# Altium project Sensor.PrjPcb (part 3 of 3)
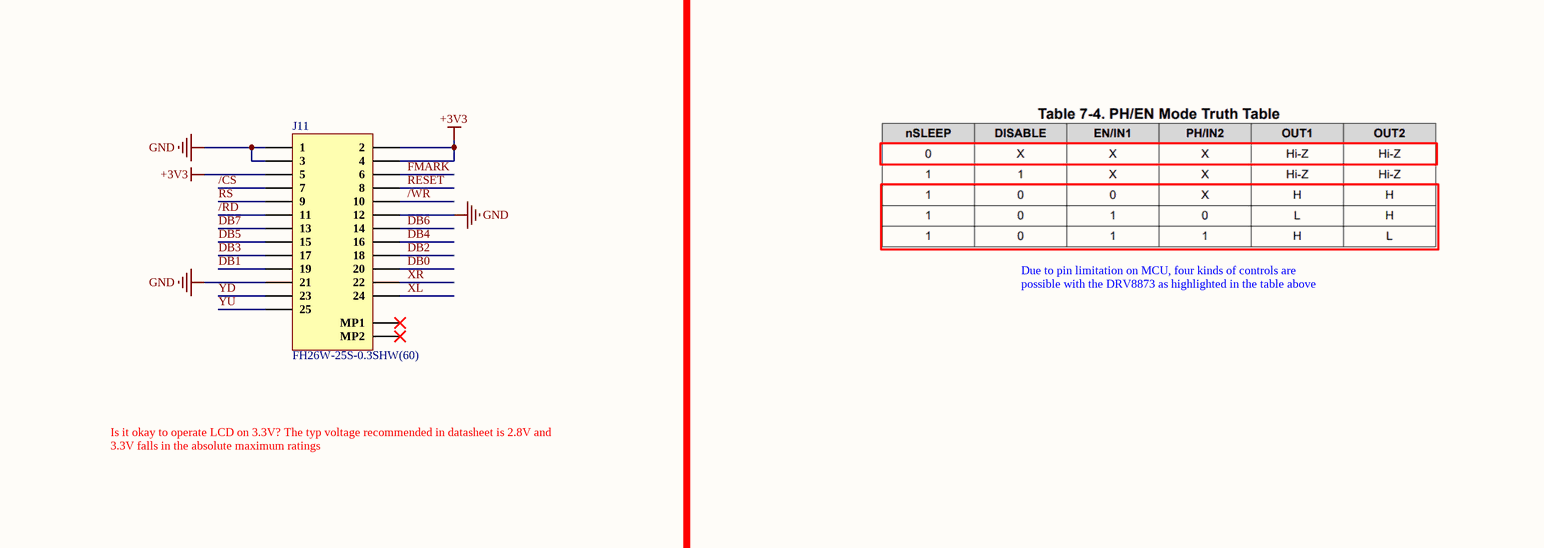
[diagram p5: Sheet4.SchDoc, bottom right]

## Sheet Sheet4.SchDoc (continued)

### Library data of the parts (continued)
R11 = CRCW04021K00FKEDHP: RES SMD 1K OHM 1% 1/5W 0402; Manufacturer: Vishay Dale; Resistance: 1kR; Temperature Coefficient: 100ppm/°C; Power Rating: 125mW; Voltage Rating: 50V; Supplier 1: Digi-Key; Manufacturer Part Number: CRCW04021K00FKEDHP; Stock 1: 315989; Pricing 1: 1=0.15, 10=0.132, 100=0.0506, 1000=0.02226, 2500=0.01923, 5000=0.0172 (USD); Mount: Surface Mount; Case/Package: 0402; Number of Pins: 2; Contact Plating: Tin; Weight: 2.3E-05oz; Case Code (Imperial): 0402; Case Code (Metric): 1005; Size Code: 0402; Min Operating Temperature: -55°C; Max Operating Temperature: 155°C; Tolerance: 1%; Resistor Type: Thick Film; Package Quantity: 10; Packaging: Tape and Reel; Number of Terminations: 2; Termination: SMD/SMT; Max Power Dissipation: 125mW; Voltage Rating (DC): 50V; Features: Automotive AEC-Q200; Series: CRCW-HP; Construction: Rectangular; Technology: THICK FILM; Resistance Tolerance: 1%; Length: 1mm; Width: 0.5mm; Height: 0.3mm; Depth: 0.5mm; Radiation Hardening: No; REACH SVHC: Unknown; Military Standard: Not; Lead Free: Lead Free; RoHS Compliant: Yes; ComponentLink1URL: http://www.farnell.com/datasheets/2339608.pdf?src-supplier=Element14; ComponentLink1Description: http://www.farnell.com/datasheets/2339608.pdf?src-supplier=Element14; ComponentLink2URL: http://www.vishay.com/docs/20043/crcwhpe3.pdf?src-supplier=Digi-Key; ComponentLink2Description: http://www.vishay.com/docs/20043/crcwhpe3.pdf?src-supplier=Digi-Key; ComponentLink3URL: http://www.mouser.com/ds/2/427/crcwhpe3-46056.pdf?src-supplier=Mouser; ComponentLink3Description: http://www.mouser.com/ds/2/427/crcwhpe3-46056.pdf?src-supplier=Mouser; ComponentLink4URL: http://www.vishay.com/docs/20043/crcwhpe3.pdf?src-supplier=Avnet; ComponentLink4Description: http://www.vishay.com/docs/20043/crcwhpe3.pdf?src-supplier=Avnet; ComponentLink5URL: http://www.vishay.com/docs/20043/crcwhpe3.pdf?src-supplier=Future+Electronics; ComponentLink5Description: http://www.vishay.com/docs/20043/crcwhpe3.pdf?src-supplier=Future+Electronics; Supplier Part Number 1: 541-1.00KYCT-ND; LCSC Part Number: C313354
R12 = CRCW06036K20JNEA: RES SMD 6.2K OHM 5% 1/10W 0603; Manufacturer: Vishay Dale; Value: 6.2kR; Temperature Coefficient: 200ppm/°C; Max Power Dissipation: 100mW; Voltage Rating: 75V; Item Type: Resistor; Supplier 1: Arrow Electronics; Manufacturer Part Number: CRCW06036K20JNEA; RoHS: Yes; Category: Chip SMD Resistors; Stock 1: 2763; Pricing 1: 1=0.06100, 10=0.02470, 25=0.02440, 50=0.02420, 100=0.01220, 250=0.01170, 500=0.01070, 1000=0.00550 (USD); Case/Package: 0603; Case Code (Metric): 1608; Case Code (Imperial): 0603; Contact Plating: Tin; Weight: 7.1E-05oz; Min Operating Temperature: -55°C; Max Operating Temperature: 155°C; Tolerance: 5%; Packaging: Tape and Reel; Resistor Type: Thick Film; Number of Terminations: 2; Features: Automotive AEC-Q200; Series: CRCW; Power Rating: 100mW; Package Quantity: 1; Termination: SMD/SMT; Voltage Rating (DC): 75V; Construction: Rectangular; Length: 1.55mm; Width: 0.033inch; Height: 0.02inch; Depth: 0.85mm; Radiation Hardening: No; Lead Free: Lead Free; RoHS Compliant: Yes; Military Standard: Not; ComponentLink1URL: https://datasheet.ciiva.com/3257/dcrcwe3-3257845.pdf?src-supplier=Avnet; ComponentLink1Description: https://datasheet.ciiva.com/3257/dcrcwe3-3257845.pdf?src-supplier=Avnet; ComponentLink2URL: https://datasheet.ciiva.com/2462/dcrcwe3-2462295.pdf?src-supplier=Digi-Key; ComponentLink2Description: https://datasheet.ciiva.com/2462/dcrcwe3-2462295.pdf?src-supplier=Digi-Key; ComponentLink3URL: https://datasheet.ciiva.com/2462/dcrcwe3-2462296.pdf?src-supplier=Digi-Key; ComponentLink3Description: https://datasheet.ciiva.com/2462/dcrcwe3-2462296.pdf?src-supplier=Digi-Key; ComponentLink4URL: https://datasheet.ciiva.com/2462/dcrcwe3-2462297.pdf?src-supplier=Digi-Key; ComponentLink4Description: https://datasheet.ciiva.com/2462/dcrcwe3-2462297.pdf?src-supplier=Digi-Key; ComponentLink5URL: https://datasheet.ciiva.com/5549/dcrcwe3-109170-5549114.pdf?src-supplier=Mouser; ComponentLink5Description: https://datasheet.ciiva.com/5549/dcrcwe3-109170-5549114.pdf?src-supplier=Mouser; Supplier Part Number 1: CRCW06036K20JNEA; LCSC Part Number: C2079587
R13 R16 R20 R24 = TNPW080510R0FEEA: RES 10 OHM 1% 1/8W 0805; Manufacturer: Vishay; Power Rating: 125mW; Voltage Rating: 150V; Temperature Coefficient: 25ppm/°C; Item Type: Resistor; Supplier 1: Mouser; Manufacturer Part Number: TNPW080510R0FEEA; RoHS: Yes; Category: Chip SMD Resistors; Stock 1: 22670; Pricing 1: 1=0.57000, 10=0.43800, 50=0.43800, 100=0.18500, 500=0.13400, 1000=0.10200, 2500=0.09600, 5000=0.08500, 10000=0.08500 (USD); Mounting Technology: Surface Mount; Case/Package: 0805; Case Code (Imperial): 0805; Case Code (Metric): 2012; Weight: 0.000194oz; Contact Plating: Tin; Min Operating Temperature: -55°C; Max Operating Temperature: 125°C; Value: 10R; Tolerance: 1%; Packaging: Tape and Reel; Resistor Type: Thin Film; Termination: SMD/SMT; Series: TNPW e3; Technology: THIN FILM; Length: 2mm; Width: 1.2mm; Height: 0.45mm; Depth: 1.25mm; Radiation Hardening: No; Lead Free: Lead Free; RoHS Compliant: Yes; ComponentLink1URL: https://datasheet.ciiva.com/16787/70201627-16787918.pdf?src-supplier=Allied+Electronics; ComponentLink1Description: https://datasheet.ciiva.com/16787/70201627-16787918.pdf?src-supplier=Allied+Electronics; Supplier Part Number 1: 71-TNPW080510R0FEEA; LCSC Part Number: C844061
R14 R22 = RL0603FR-070R1L: RES 0.1 OHM 1% 1/10W 0603; Manufacturer: Yageo; Value: 100mR; Temperature Coefficient: 800ppm/°C; Voltage Rating (DC): 50V; Power Rating: 100mW; Item Type: Resistor; Supplier 1: Future Electronics; Manufacturer Part Number: RL0603FR-070R1L; RoHS: Yes; Category: Chip SMD Resistors; Stock 1: 530000; Pricing 1: 5000=0.02140, 15000=0.02080, 20000=0.02050, 50000=0.02000, 75000=0.01970, 100000=0.01960, 150000=0.01930, 200000=0.01880, 375000=0.01840 (USD); Case/Package: 0603; Pins: 2; Contact Plating: Tin,Matte; Case Code (Metric): 1608; Case Code (Imperial): 0603; Weight: 7.1E-05oz; Min Operating Temperature: -55°C; Max Operating Temperature: 125°C; Resistor Type: Thick Film; Tolerance: 1%; Package Quantity: 1; Packaging: Tape and Reel; Voltage Rating: 50V; Number of Terminations: 2; Termination: SMD/SMT; Max Power Dissipation: 100mW; Features: Moisture Resistant; Series: RL; Technology: THICK FILM; Resistance Tolerance: 1%; Construction: Rectangular; Length: 0.063inch; Width: 0.8mm; Height: 0.022inch; Depth: 0.8mm; Lead Pitch: 0.25mm; Radiation Hardening: No; RoHS Compliant: Yes; Military Standard: Not; Lead Free: Lead Free; ComponentLink1URL: https://datasheet.ciiva.com/15328/pyu-rl-521-rohs-l-5-15328748.pdf?src-supplier=Mouser; ComponentLink1Description: https://datasheet.ciiva.com/15328/pyu-rl-521-rohs-l-5-15328748.pdf?src-supplier=Mouser; ComponentLink2URL: https://datasheet.ciiva.com/7746/877049-7746575.pdf?src-supplier=Element14; ComponentLink2Description: https://datasheet.ciiva.com/7746/877049-7746575.pdf?src-supplier=Element14; Supplier Part Number 1: 1378876; LCSC Part Number: C326946
R15 = RC0603FR-07200KL: RES SMD 200K OHM 1% 1/10W 0603; Manufacturer: Yageo; Item Type: Resistor; Manufacturer Part Number: RC0603FR-07200KL; Package: 0603; ComponentLink3URL: https://www.lcsc.com/product-detail/Chip-Resistor-Surface-Mount_YAGEO-RC0603FR-07200KL_C105574.html; ComponentLink3Description: LCSC; LCSC Part Number: C105574
R17 = RT0603BRD0768KL: RES SMD 68K OHM 0.1% 1/10W 0603; Manufacturer: Yageo; Resistance: 68kR; Power Rating: 100mW; Voltage Rating: 75V; Temperature Coefficient: 25ppm/°C; Voltage Rating (DC): 50V; Supplier 1: Digi-Key; Manufacturer Part Number: RT0603BRD0768KL; RoHS: Yes; Category: Chip SMD Resistors; Stock 1: 45000; Pricing 1: 1=0.34000, 10=0.28800, 100=0.11260, 1000=0.04716, 2500=0.04322 (USD); Case/Package: 0603; Case Code (Metric): 1608; Case Code (Imperial): 0603; Contact Plating: Tin,Matte; Min Operating Temperature: -55°C; Max Operating Temperature: 125°C; Tolerance: 0.1%; Packaging: Tape and Reel; Resistor Type: Thin Film; Termination: SMD/SMT; Series: RT; Construction: Rectangular; Length: 1.6mm; Width: 800um; Depth: 0.8mm; Radiation Hardening: No; Military Standard: Not; Lead Free: Lead Free; RoHS Compliant: Yes; ComponentLink1URL: https://datasheet.ciiva.com/12694/pyu-rt-1-to-0-05-rohs-l-4-12694907.pdf?src-supplier=Mouser; ComponentLink1Description: https://datasheet.ciiva.com/12694/pyu-rt-1-to-0-05-rohs-l-4-12694907.pdf?src-supplier=Mouser; Supplier Part Number 1: YAG4586CT-ND
R18 = ERJ-2RKF47R0X: RES SMD 47 OHM 1% 1/10W 0402; Manufacturer: Panasonic; Temperature Coefficient: 100ppm/°C; Power Rating: 100mW; Voltage Rating: 50V; Item Type: Resistor; Supplier 1: Avnet; Manufacturer Part Number: ERJ-2RKF47R0X; RoHS: Yes; Category: Chip SMD Resistors; Stock 1: 48669; Pricing 1: 1=0.08100, 25=0.03700, 100=0.01500, 250=0.01300, 500=0.01000, 1000=0.00700, 2500=0.00500 (USD); Mount: Surface Mount; Case/Package: 0402; Number of Pins: 2; Contact Plating: Tin; Case Code (Metric): 1005; Case Code (Imperial): 0402; Weight: 2.8E-05oz; Min Operating Temperature: -55°C; Max Operating Temperature: 155°C; Resistance: 47R; Tolerance: 1%; Resistor Type: Thick Film; Packaging: Tape and Reel; Package Quantity: 1; Number of Terminations: 2; Termination: SMD/SMT; Max Power Dissipation: 100mW; Voltage Rating (DC): 50V; Features: Automotive AEC-Q200; Series: ERJ; Resistance Tolerance: 1%; Construction: Rectangular; Technology: THICK FILM; Length: 1mm; Width: 0.5mm; Height: 0.35mm; Depth: 0.5mm; Reach SVHC Compliant: Yes; Military Standard: Not; Lead Free: Lead Free; RoHS Compliant: Yes; ComponentLink1URL: https://datasheet.ciiva.com/11821/0900766b80f80784-11821333.pdf?src-supplier=RSComponents; ComponentLink1Description: https://datasheet.ciiva.com/11821/0900766b80f80784-11821333.pdf?src-supplier=RSComponents; ComponentLink2URL: https://datasheet.ciiva.com/6082/aoa0000ce2-6082054.pdf?src-supplier=Farnell; ComponentLink2Description: https://datasheet.ciiva.com/6082/aoa0000ce2-6082054.pdf?src-supplier=Farnell; ComponentLink3URL: https://datasheet.ciiva.com/7886/aoa0000ce2-7886719.pdf?src-supplier=Element14; ComponentLink3Description: https://datasheet.ciiva.com/7886/aoa0000ce2-7886719.pdf?src-supplier=Element14; ComponentLink4URL: https://datasheet.ciiva.com/7887/426256-7887019.pdf?src-supplier=Element14; ComponentLink4Description: https://datasheet.ciiva.com/7887/426256-7887019.pdf?src-supplier=Element14; ComponentLink5URL: https://datasheet.ciiva.com/43467/1678782-43467189.pdf?src-supplier=Farnell; ComponentLink5Description: https://datasheet.ciiva.com/43467/1678782-43467189.pdf?src-supplier=Farnell; ComponentLink6URL: https://datasheet.ciiva.com/46373/1678782-46373909.pdf?src-supplier=Element14; ComponentLink6Description: https://datasheet.ciiva.com/46373/1678782-46373909.pdf?src-supplier=Element14; ComponentLink7URL: https://datasheet.ciiva.com/22684/1678782-22684775.pdf?src-supplier=Element14; ComponentLink7Description: https://datasheet.ciiva.com/22684/1678782-22684775.pdf?src-supplier=Element14; ComponentLink8URL: https://datasheet.ciiva.com/46373/1678782-46373910.pdf?src-supplier=Element14; ComponentLink8Description: https://datasheet.ciiva.com/46373/1678782-46373910.pdf?src-supplier=Element14; ComponentLink9URL: https://datasheet.ciiva.com/24165/aoa0000ce2-24165246.pdf?src-supplier=Mouser; ComponentLink9Description: https://datasheet.ciiva.com/24165/aoa0000ce2-24165246.pdf?src-supplier=Mouser; ComponentLink10URL: https://datasheet.ciiva.com/16786/70260748-16786359.pdf?src-supplier=Allied+Electronics; ComponentLink10Description: https://datasheet.ciiva.com/16786/70260748-16786359.pdf?src-supplier=Allied+Electronics; ComponentLink11URL: https://datasheet.ciiva.com/16783/70260748-16783259.pdf?src-supplier=Allied+Electronics; ComponentLink11Description: https://datasheet.ciiva.com/16783/70260748-16783259.pdf?src-supplier=Allied+Electronics; ComponentLink12URL: https://datasheet.ciiva.com/9189/aoa0000ce2-9189325.pdf?src-supplier=Avnet; ComponentLink12Description: https://datasheet.ciiva.com/9189/aoa0000ce2-9189325.pdf?src-supplier=Avnet; ComponentLink13URL: https://datasheet.ciiva.com/9189/aoa0000ce2-9189323.pdf?src-supplier=Avnet; ComponentLink13Description: https://datasheet.ciiva.com/9189/aoa0000ce2-9189323.pdf?src-supplier=Avnet; Supplier Part Number 1: 64R5286; LCSC Part Number: C413056
R19 = RC0402FR-0751KL: RES 51K OHM 1% 1/16W 0402; Manufacturer: Yageo; Power Rating: 63mW; Temperature Coefficient: 100ppm/°C; Value: 51kR; Voltage Rating: 50V; Item Type: Resistor; Supplier 1: Future Electronics; Manufacturer Part Number: RC0402FR-0751KL; RoHS: Yes; Category: Chip SMD Resistors; Stock 1: 610000; Pricing 1: 10000=0.00100, 50000=0.00100, 300000=0.00090, 1000000=0.00090, 3000000=0.00080 (USD); Case/Package: 0402; Case Code (Imperial): 0402; Case Code (Metric): 1005; Min Operating Temperature: -55°C; Max Operating Temperature: 155°C; Tolerance: 1%; Technology: THICK FILM; Packaging: Cut Tape; Package Quantity: 1; Termination: SMD/SMT; Resistor Type: Thick Film; Number of Terminations: 2; Max Power Dissipation: 63mW; Voltage Rating (DC): 50V; Working Voltage: 50V; Features: Moisture Resistant; Series: RC; Resistance Tolerance: 1%; Construction: Rectangular; Length: 0.039inch; Width: 0.02inch; Height: 0.016inch; Depth: 0.5mm; RoHS Compliant: Yes; Military Standard: Not; Lead Free: Lead Free; ComponentLink1URL: https://datasheet.ciiva.com/7850/1018594-7850037.pdf?src-supplier=Element14; ComponentLink1Description: https://datasheet.ciiva.com/7850/1018594-7850037.pdf?src-supplier=Element14; ComponentLink2URL: https://datasheet.ciiva.com/2519/pyu-r-int-thick-7-2519211.pdf?src-supplier=Digi-Key; ComponentLink2Description: https://datasheet.ciiva.com/2519/pyu-r-int-thick-7-2519211.pdf?src-supplier=Digi-Key; ComponentLink3URL: https://datasheet.ciiva.com/2519/pyu-r-int-thick-7-2519212.pdf?src-supplier=Digi-Key; ComponentLink3Description: https://datasheet.ciiva.com/2519/pyu-r-int-thick-7-2519212.pdf?src-supplier=Digi-Key; ComponentLink4URL: https://datasheet.ciiva.com/2519/pyu-r-int-thick-7-2519210.pdf?src-supplier=Digi-Key; ComponentLink4Description: https://datasheet.ciiva.com/2519/pyu-r-int-thick-7-2519210.pdf?src-supplier=Digi-Key; Supplier Part Number 1: 6056592; LCSC Part Number: C107229
R21 = RC0201FR-0723K7L: RES 23.7K OHM 1% 1/20W 0201; Manufacturer: Yageo; Value: 23.7kR; Max Power Dissipation: 50mW; Temperature Coefficient: 200ppm/°C; Item Type: Resistor; Supplier 1: Arrow Electronics; Manufacturer Part Number: RC0201FR-0723K7L; RoHS: Yes; Category: Chip SMD Resistors; Stock 1: 11544; Pricing 1: 1=0.09400, 10=0.01600, 25=0.01580, 100=0.00660, 250=0.00650, 1000=0.00380, 3000=0.00280 (USD); Case/Package: 0201; Case Code (Metric): 0603; Case Code (Imperial): 0201; Min Operating Temperature: -55°C; Max Operating Temperature: 125°C; Packaging: Cut Tape; Number of Terminations: 2; Tolerance: 1%; Features: Moisture Resistant; Series: RC; Lead Free: Lead Free; RoHS Compliant: Yes; ComponentLink1URL: http://www.yageo.com/documents/recent/PYu-RC_Group_51_RoHS_L_9.pdf?src-supplier=Digi-Key; ComponentLink1Description: http://www.yageo.com/documents/recent/PYu-RC_Group_51_RoHS_L_9.pdf?src-supplier=Digi-Key; Supplier Part Number 1: RC0201FR-0723K7L; LCSC Part Number: C474614
R23 = RC0603FR-07100RL: RES SMD 100 OHM 1% 1/10W 0603; Manufacturer: Yageo; Temperature Coefficient: 100ppm/°C; Voltage Rating (DC): 50V; Power Rating: 100mW; Supplier 1: Arrow Electronics; Manufacturer Part Number: RC0603FR-07100RL; RoHS: Yes; Category: Chip SMD Resistors; Stock 1: 3800000; Pricing 1: 5000=0.00300, 5000=0.00200, 5000=0.00450, 50000=0.00410, 500000=0.00230, 2500000=0.00140 (USD); Case/Package: 0603; Number of Pins: 2; Case Code (Imperial): 0603; Case Code (Metric): 1608; Size Code: 0603; Min Operating Temperature: -55°C; Max Operating Temperature: 155°C; Resistance: 100R; Tolerance: 1%; Resistor Type: Thick Film; Packaging: Tape and Reel; Voltage Rating: 50V; Termination: SMD/SMT; Features: Moisture Resistant; Series: RC; Max Power Dissipation: 100mW; Number of Terminations: 2; Construction: Rectangular; Resistance Tolerance: 1%; Technology: THICK FILM; Length: 1.6mm; Width: 0.8mm; Height: 0.45mm; Depth: 0.8mm; REACH SVHC: Unknown; Lead Free: Lead Free; RoHS Compliant: Yes; Military Standard: Not; Supplier Part Number 1: RC0603FR-07100RL; LCSC Part Number: C105588
R25 = ERJ3EKF3300V: RES SMD 330 OHM 1% 1/10W 0603; Manufacturer: Panasonic; Power Rating: 100mW; Voltage Rating: 75V; Temperature Coefficient: 100ppm/°C; Item Type: Resistor; Supplier 1: Rs; Manufacturer Part Number: ERJ3EKF3300V; RoHS: Yes; Category: Chip SMD Resistors; Stock 1: 205000; Pricing 1: 5000=0.00000 (GBP); Mounting Technology: Surface Mount; Case/Package: 0603; Pins: 2; Case Code (Imperial): 0603; Case Code (Metric): 1608; Weight: 7.1E-05oz; Contact Plating: Tin; Min Operating Temperature: -55°C; Max Operating Temperature: 155°C; Tolerance: 1%; Value: 330R; Packaging: Tape and Reel; Package Quantity: 5000; Resistor Type: Thick Film; Termination: SMD/SMT; Number of Terminations: 2; Max Power Dissipation: 100mW; Voltage Rating (DC): 75V; Features: Automotive AEC-Q200; Series: ERJ; Resistance Tolerance: 1%; Construction: Rectangular; Length: 1.6mm; Width: 0.8mm; Height: 0.45mm; Depth: 0.8mm; Radiation Hardening: No; Reach SVHC Compliant: Yes; Military Standard: Not; Lead Free: Lead Free; RoHS Compliant: Yes; ComponentLink1URL: https://datasheet.ciiva.com/7886/aoa0000ce2-7886729.pdf?src-supplier=Element14; ComponentLink1Description: https://datasheet.ciiva.com/7886/aoa0000ce2-7886729.pdf?src-supplier=Element14; ComponentLink2URL: https://datasheet.ciiva.com/46373/1678782-46373899.pdf?src-supplier=Element14; ComponentLink2Description: https://datasheet.ciiva.com/46373/1678782-46373899.pdf?src-supplier=Element14; ComponentLink3URL: https://datasheet.ciiva.com/22721/426256-22721099.pdf?src-supplier=Element14; ComponentLink3Description: https://datasheet.ciiva.com/22721/426256-22721099.pdf?src-supplier=Element14; ComponentLink4URL: https://datasheet.ciiva.com/46373/1678782-46373900.pdf?src-supplier=Element14; ComponentLink4Description: https://datasheet.ciiva.com/46373/1678782-46373900.pdf?src-supplier=Element14; Supplier Part Number 1: 1229278
R26 = FRC0603F1693TS: ±1% 169kΩ 0603 Chip Resistor - Surface Mount ROHS; Manufacturer: FOJAN; Manufacturer Part Number: FRC0603F1693TS; Package: 0603; LCSC Part: C3013192; Item Type: Resistor; ComponentLink1Description: LCSC; ComponentLink1URL: https://www.lcsc.com/product-detail/span-style-background-color-ff0-Chip-span-span-style-background-color-ff0-Resistor-span-Surface-Mount_FOJAN-FRC0603F1693TS_C3013192.html
R28 = RT0402BRD07806RL: RES SMD 806 OHM 0.1% 1/16W 0402; Manufacturer: Yageo; Voltage Rating: 50V; Power Rating: 62.5mW; Temperature Coefficient: 25ppm/°C; Max Power Dissipation: 63mW; Item Type: Resistor; Supplier 1: Arrow Electronics; Manufacturer Part Number: RT0402BRD07806RL; RoHS: Yes; Category: Chip SMD Resistors; Stock 1: 104; Pricing 1: 1=0.32050, 10=0.28580, 25=0.25690, 100=0.10950 (USD); Case/Package: 0402; Case Code (Metric): 1005; Case Code (Imperial): 0402; Min Operating Temperature: -55°C; Max Operating Temperature: 155°C; Resistance: 806R; Tolerance: 0.1%; Packaging: Tape and Reel; Package Quantity: 10000; Resistor Type: Thin Film; Termination: SMD/SMT; Number of Terminations: 2; Voltage Rating (DC): 50V; Features: Moisture Resistant; Series: RT; Length: 0.039inch; Width: 0.02inch; Height: 0.014inch; Lead Free: Lead Free; RoHS Compliant: Yes; ComponentLink1URL: https://datasheet.ciiva.com/2582/pyu-rt-1-to-0-05-rohs-l-4-2582500.pdf?src-supplier=Digi-Key; ComponentLink1Description: https://datasheet.ciiva.com/2582/pyu-rt-1-to-0-05-rohs-l-4-2582500.pdf?src-supplier=Digi-Key; ComponentLink2URL: https://datasheet.ciiva.com/46635/pyu-rt-1-to-0-05-rohs-l-5-46635068.pdf?src-supplier=Digi-Key; ComponentLink2Description: https://datasheet.ciiva.com/46635/pyu-rt-1-to-0-05-rohs-l-5-46635068.pdf?src-supplier=Digi-Key; LCSC Part Number: C852922; Supplier Part Number 1: RT0402BRD07806RL
R31 R32 = RC0603FR-070RL: RES SMD 0R, 1%, 0.1W, 0603; Manufacturer: Yageo; Item Type: Resistor; Manufacturer Part Number: RC0603FR-070RL; Package: 0603; LCSC Part Number: C100044; ComponentLink9Description: LCSC; ComponentLink9URL: https://www.lcsc.com/product-detail/Chip-Resistor-Surface-Mount_YAGEO-RC0603FR-070RL_C100044.html
SW1 = TS-1185EC-C-D-B: 3mm 2mm Round Button 50mA Top3.65mm SPST 12V SMD Tactile Switches; Manufacturer: XKB; Manufacturer Part Number: TS-1185EC-C-D-B; Footprint: Custom; ComponentLink1Description: LCSC; ComponentLink1URL: https://lcsc.com/product-detail/Tactile-Switches_XKB-Connectivity-TS-1185EC-C-D-B_C318893.html; LCSC Part Number: C318893
U1 U3 = MT3608: boost converterType 1 Boost 28V 2V~24V 1.2MHz SOT-23-6 DC-DC Converters ROHS; Manufacturer: XI'AN Aerosemi Tech; Item Type: IC; Manufacturer Part Number: MT3608; Package: SOT-23-6; LCSC Part Number: C84817; ComponentLink1Description: LCSC; ComponentLink1URL: https://www.lcsc.com/product-detail/DC-DC-Converters_XI-AN-Aerosemi-Tech-MT3608_C84817.html
U2 = STM32F103RCT6: IC MCU 32BIT 256KB FLASH 64LQFP; Manufacturer: STMicroelectronics; Interface: I2C,SPI,USB,CAN,USART; RAM Size: 48KB; Max Supply Voltage: 3.6V; Number of I/Os: 51; Number of Timers/Counters: 8; Min Supply Voltage: 2V; Data Bus Width: 32b; Clock Frequency: 72MHz; Core Architecture: ARM; Number of ADC Channels: 16; Supplier 1: Mouser; Manufacturer Part Number: STM32F103RCT6; RoHS: Yes; Category: Microcontrollers; Stock 1: 44788; Pricing 1: 1=9.74000, 10=8.79000, 50=8.38000, 100=7.28000, 1000=5.58000, 10000=5.58000 (USD); Case/Package: LQFP; Pins: 64; Weight: 0.012088oz; Min Operating Temperature: -40°C; Max Operating Temperature: 85°C; Package Quantity: 960; Packaging: Tray; Memory Format: FLASH; Memory Size: 256KB; Series: STM32F103RC; Length: 10mm; Width: 10mm; Height: 1.4mm; Lead Free: Lead Free; RoHS Compliant: Yes; ComponentLink1URL: https://datasheet.ciiva.com/4845/cd00191185-4845648.pdf?src-supplier=Mouser; ComponentLink1Description: https://datasheet.ciiva.com/4845/cd00191185-4845648.pdf?src-supplier=Mouser; ComponentLink2URL: https://datasheet.ciiva.com/8054/1831497-8054949.pdf?src-supplier=Element14; ComponentLink2Description: https://datasheet.ciiva.com/8054/1831497-8054949.pdf?src-supplier=Element14; ComponentLink3URL: https://datasheet.ciiva.com/5752/cd00191185-5752853.pdf?src-supplier=Farnell; ComponentLink3Description: https://datasheet.ciiva.com/5752/cd00191185-5752853.pdf?src-supplier=Farnell; ComponentLink4URL: https://datasheet.ciiva.com/9224/cd00191185-9224408.pdf?src-supplier=Avnet; ComponentLink4Description: https://datasheet.ciiva.com/9224/cd00191185-9224408.pdf?src-supplier=Avnet; ComponentLink5URL: https://datasheet.ciiva.com/16382/cd00191185-16382444.pdf?src-supplier=Future+Electronics; ComponentLink5Description: https://datasheet.ciiva.com/16382/cd00191185-16382444.pdf?src-supplier=Future+Electronics; Supplier Part Number 1: 511-STM32F103RCT6; LCSC Part Number: C8323; Item Type: IC
U4 U5 = DRV8873HPWPRQ1: IC MTRDRV UNIPLR 0-5.5V 24HTSSOP; Manufacturer: Texas Instruments; Logic Function: AND GATE; Interface: SPI; Output Current: 10mA; ComponentLink1URL: https://www.ti.com/lit/ds/symlink/drv8873-q1.pdf?src-supplier=Digi-Key; ComponentLink1Description: https://www.ti.com/lit/ds/symlink/drv8873-q1.pdf?src-supplier=Digi-Key; ComponentLink2URL: http://www.ti.com/general/docs/suppproductinfo.tsp?distId=10&amp;gotoUrl=http%3A%2F%2Fwww.ti.com%2Flit%2Fgpn%2Fdrv8873-q1&src-supplier=Digi-Key; ComponentLink2Description: http://www.ti.com/general/docs/suppproductinfo.tsp?distId=10&amp;gotoUrl=http%3A%2F%2Fwww.ti.com%2Flit%2Fgpn%2Fdrv8873-q1&src-supplier=Digi-Key; LCSC Part Number: C2150479; Item Type: IC; Supplier 1: Digi-Key; Manufacturer Part Number: DRV8873HPWPRQ1; RoHS: Yes; Category: Motor Drivers; Pricing 1: 1=7.02000, 5=6.19800, 10=5.47500, 25=4.44200, 50=3.92540, 100=3.82210, 500=3.20230, 1000=3.09900 (USD); Mounting Technology: Surface Mount; Min Operating Temperature: -40°C; Max Operating Temperature: 125°C; Packaging: Cut Tape; RoHS Compliant: Yes; Supplier Part Number 1: 296-50274-1-ND
U6 = MCP73213-A6SI/MF: IC BATT CONTRL LI-ION 2CEL 10DFN; Manufacturer: Microchip; Number of Cells: 2; Max Supply Voltage: 18V; Min Supply Voltage: 4.2V; Output Voltage: 8.4V; Max Output current: 1.1A; Operating Supply Current: 700uA; Drain to Source Resistance: 350mR; Max Output Voltage: 8.85V; Min Output Voltage: 8.15V; Fault Protection: Over Voltage; Supplier 1: Rs; Manufacturer Part Number: MCP73213-A6SI/MF; RoHS: Yes; Category: Battery Management; Stock 1: 128; Pricing 1: 1=-1.00000, 25=1.85000, 100=1.76000 (GBP); Mounting Technology: Surface Mount; Case/Package: DFN; Pins: 10; Min Operating Temperature: -40°C; Max Operating Temperature: 85°C; Package Quantity: 120; Packaging: Rail/Tube; Number of Channels: 2; Max Charge Current: 1.1A; Voltage Rating: 8.85V; Series: -; Battery Pack Voltage: 8.4V; Length: 3mm; Width: 3mm; Height: 0.88mm; Radiation Hardening: No; Reach SVHC Compliant: Yes; Lead Free: Lead Free; RoHS Compliant: Yes; ComponentLink1URL: https://datasheet.ciiva.com/1137/554364-1137792.pdf?src-supplier=Element14; ComponentLink1Description: https://datasheet.ciiva.com/1137/554364-1137792.pdf?src-supplier=Element14; ComponentLink2URL: https://datasheet.ciiva.com/16453/filehandler-aspxddocname-en544011-16453863.pdf?src-supplier=Future+Electronics; ComponentLink2Description: https://datasheet.ciiva.com/16453/filehandler-aspxddocname-en544011-16453863.pdf?src-supplier=Future+Electronics; ComponentLink3URL: https://datasheet.ciiva.com/1137/22190b-1137793.pdf?src-supplier=Element14; ComponentLink3Description: https://datasheet.ciiva.com/1137/22190b-1137793.pdf?src-supplier=Element14; ComponentLink4URL: https://datasheet.ciiva.com/4873/22190a-13379-4873436.pdf?src-supplier=Mouser; ComponentLink4Description: https://datasheet.ciiva.com/4873/22190a-13379-4873436.pdf?src-supplier=Mouser; ComponentLink5URL: https://datasheet.ciiva.com/3213/22190b-3213399.pdf?src-supplier=Avnet; ComponentLink5Description: https://datasheet.ciiva.com/3213/22190b-3213399.pdf?src-supplier=Avnet; ComponentLink6URL: https://datasheet.ciiva.com/1933/22190b-1933113.pdf?src-supplier=Digi-Key; ComponentLink6Description: https://datasheet.ciiva.com/1933/22190b-1933113.pdf?src-supplier=Digi-Key; Supplier Part Number 1: 6878660; LCSC Part Number: C60668; Item Type: IC
U7 U9 = INA219AIDCNR: IC CURRENT MONITOR 1% SOT23-8; Manufacturer: Texas Instruments; Nominal Supply Current: 700uA; Common Mode Rejection Ratio: 100dB; Max Supply Voltage: 5.5V; Min Supply Voltage: 3V; Output Current: 10mA; Bandwidth: 3.4MHz; Min Input Voltage: 0V; Operating Supply Current: 1mA; Number of Amplifiers: 1; Input Offset Voltage (Vos): 100uV; Max Supply Current: 5mA; Output Type: Digital; Supplier 1: Mouser; Manufacturer Part Number: INA219AIDCNR; RoHS: Yes; Category: Amplifiers - Op Amps, Buffer, Instrumentation; Stock 1: 22974; Pricing 1: 1=2.62000, 10=2.36000, 50=2.23000, 100=1.90000, 1000=1.29000, 10000=1.21000 (USD); Case/Package: SOT-23-8; Pins: 8; Contact Plating: Gold; Weight: 0.001411oz; Min Operating Temperature: -40°C; Max Operating Temperature: 125°C; Packaging: Tape and Reel; Package Quantity: 3000; Accuracy: 1%; Series: Zero-Drift; Supply Current: 700uA; Quiescent Current: 700uA; Output Current per Channel: 10mA; Features: I²C; Length: 3mm; Width: 1.75mm; Height: 1.3mm; Radiation Hardening: No; RoHS Compliant: Yes; Lead Free: Lead Free; Reach SVHC Compliant: Yes; ComponentLink1URL: https://datasheet.ciiva.com/15132/getdatasheetpartid-327029-15132621.pdf?src-supplier=Verical; ComponentLink1Description: https://datasheet.ciiva.com/15132/getdatasheetpartid-327029-15132621.pdf?src-supplier=Verical; ComponentLink2URL: https://datasheet.ciiva.com/1492/ina219-1492467.pdf?src-supplier=Farnell; ComponentLink2Description: https://datasheet.ciiva.com/1492/ina219-1492467.pdf?src-supplier=Farnell; ComponentLink3URL: https://datasheet.ciiva.com/1484/1725057-1484939.pdf?src-supplier=Element14; ComponentLink3Description: https://datasheet.ciiva.com/1484/1725057-1484939.pdf?src-supplier=Element14; ComponentLink4URL: https://datasheet.ciiva.com/22658/1725057-22658890.pdf?src-supplier=Element14; ComponentLink4Description: https://datasheet.ciiva.com/22658/1725057-22658890.pdf?src-supplier=Element14; ComponentLink5URL: https://datasheet.ciiva.com/1939/ina219-1939574.pdf?src-supplier=Digi-Key; ComponentLink5Description: https://datasheet.ciiva.com/1939/ina219-1939574.pdf?src-supplier=Digi-Key; ComponentLink6URL: https://datasheet.ciiva.com/1939/ina219-1939573.pdf?src-supplier=Digi-Key; ComponentLink6Description: https://datasheet.ciiva.com/1939/ina219-1939573.pdf?src-supplier=Digi-Key; ComponentLink7URL: https://datasheet.ciiva.com/1939/ina219-1939575.pdf?src-supplier=Digi-Key; ComponentLink7Description: https://datasheet.ciiva.com/1939/ina219-1939575.pdf?src-supplier=Digi-Key; ComponentLink8URL: https://datasheet.ciiva.com/2965/ina219-2965724.pdf?src-supplier=Avnet; ComponentLink8Description: https://datasheet.ciiva.com/2965/ina219-2965724.pdf?src-supplier=Avnet; Supplier Part Number 1: 595-INA219AIDCNR; LCSC Part Number: C87469; Item Type: IC
U8 = TPS54240DGQR: IC REG BCK SPLIT RAIL ADJ 10MSOP; Manufacturer: Texas Instruments; Switching Frequency: 2.5MHz; Output Voltage: 39V; Output Current: 2.5A; Number of Outputs: 1; Max Supply Voltage: 42V; Min Input Voltage: 3.5V; Synchronous Rectifier: No; Min Output Voltage: 800mV; Quiescent Current: 138uA; Topology: Buck-Boost; Output Type: Adjustable; Supplier 1: Digi-Key; Manufacturer Part Number: TPS54240DGQR; RoHS: Yes; Category: Voltage Regulators - Switching; Pricing 1: 1=3.26000, 10=2.93100, 25=2.77120, 100=2.40190, 250=2.27868, 500=2.04466, 1000=1.74300 (USD); Case/Package: HVSSOP; Pins: 10; Contact Plating: Gold; Min Operating Temperature: -40°C; Max Operating Temperature: 125°C; Packaging: Tape and Reel; Package Quantity: 1; Max Output current: 2.5A; Max Output Voltage: 39V; Series: SWIFT™, Eco-Mode™; Min Supply Voltage: 3.5V; Operating Supply Voltage: 42V; Length: 3.1mm; Width: 3.1mm; Height: 0.95mm; Radiation Hardening: No; Reach SVHC Compliant: Yes; Lead Free: Lead Free; RoHS Compliant: Yes; ComponentLink1URL: https://datasheet.ciiva.com/2026/tps54240-2026016.pdf?src-supplier=Digi-Key; ComponentLink1Description: https://datasheet.ciiva.com/2026/tps54240-2026016.pdf?src-supplier=Digi-Key; ComponentLink2URL: https://datasheet.ciiva.com/41462/001014834-da-01-en-ic-reg-buck-ad-tps54240dgqr-vssop-10-tid-41462681.pdf?src-supplier=Conrad; ComponentLink2Description: https://datasheet.ciiva.com/41462/001014834-da-01-en-ic-reg-buck-ad-tps54240dgqr-vssop-10-tid-41462681.pdf?src-supplier=Conrad; ComponentLink3URL: https://datasheet.ciiva.com/2026/tps54240-2026015.pdf?src-supplier=Digi-Key; ComponentLink3Description: https://datasheet.ciiva.com/2026/tps54240-2026015.pdf?src-supplier=Digi-Key; ComponentLink4URL: https://datasheet.ciiva.com/2026/tps54240-2026014.pdf?src-supplier=Digi-Key; ComponentLink4Description: https://datasheet.ciiva.com/2026/tps54240-2026014.pdf?src-supplier=Digi-Key; ComponentLink5URL: https://datasheet.ciiva.com/14378/slvsaa6-14378059.pdf?src-supplier=Avnet; ComponentLink5Description: https://datasheet.ciiva.com/14378/slvsaa6-14378059.pdf?src-supplier=Avnet; Supplier Part Number 1: 296-27414-1-ND; LCSC Part Number: C53213; Item Type: IC
U10 = AMS1117-3.3: SOT-223 Linear Voltage Regulators (LDO) ROHS; Manufacturer: GUOXIN JIAPIN SEMICONDUCTOR; Item Type: IC; Manufacturer Part Number: AMS1117-3.3; Package: SOT-223; LCSC Part Number: C2992570; ComponentLink1Description: LCSC; ComponentLink1URL: https://www.lcsc.com/product-detail/Linear-Voltage-Regulators-LDO_GUOXIN-JIAPIN-SEMICONDUCTOR-AMS1117-3-3_C2992570.html
X1 = ABM3-8.000MHZ-D2Y-T: 5032 2-SMD 8MHz 18pF ±20ppm -40°C~85°C; Manufacturer: Abracon; ESR (Equivalent Series Resistance): 140R; Frequency Stability: 30ppm; ESR: 500R; Item Type: Crystal; Supplier 1: Future Electronics; Manufacturer Part Number: ABM3-8.000MHZ-D2Y-T; RoHS: Yes; Category: Crystals; Stock 1: 294000; Pricing 1: 1000=0.36500, 2000=0.35500, 3000=0.35000, 4000=0.34500, 5000=0.33500 (USD); Mounting Technology: Surface Mount; Case/Package: SMD/SMT; Pins: 2; Min Operating Temperature: -40°C; Max Operating Temperature: 85°C; Frequency: 8MHz; Tolerance: 20ppm; Load Capacitance: 18pF; Packaging: Cut Tape; Package Quantity: 1000; Frequency Tolerance: 20ppm; Termination: SMD/SMT; Resistor Type: Ceramic; Series: ABM3; Length: 5mm; Width: 3.2mm; Height: 0.051inch; Depth: 3.2mm; Radiation Hardening: No; Lead Free: Lead Free; RoHS Compliant: Yes; ComponentLink1URL: https://datasheet.ciiva.com/862/abm3-862465.pdf?src-supplier=Digi-Key; ComponentLink1Description: https://datasheet.ciiva.com/862/abm3-862465.pdf?src-supplier=Digi-Key; Supplier Part Number 1: 9005104; LCSC Part Number: C144380
X2 = CM8V-T1A-32.768KHZ-6PF-20PPM-TA-QC: Crystal 32.768KHZ 6.0PF SMD; Manufacturer: Micro Crystal; Supplier 1: Digi-Key; Manufacturer Part Number: CM8V-T1A-32.768KHZ-6PF-20PPM-TA-QC; RoHS: No; Stock 1: 21000; Pricing 1: 1=0.68000, 10=0.56400, 50=0.50740, 100=0.45100, 500=0.42844 (USD); Supplier Part Number 1: 2195-CM8V-T1A-32.768KHZ-6PF-20PPM-TA-QCCT-ND